# Altium schematic sheet Connector.SchDoc
size 420 x 297 mm; SheetNumber: 8; SheetTotal: 8
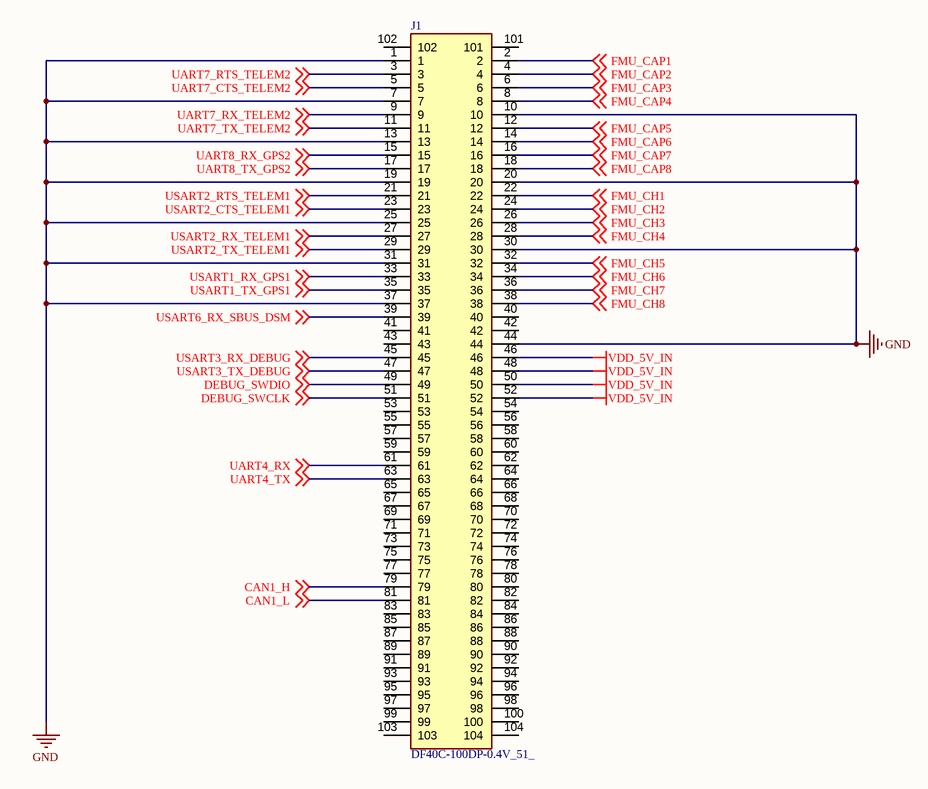
[diagram p0: Connector.SchDoc]

## Parts
J1  DF40C-100DP-0.4V_51_  [DF40C100DP04V51]

## Nets
GND: J1.1 J1.7 J1.10 J1.13 J1.19 J1.20 J1.25 J1.30 J1.31 J1.37 J1.44
VDD_5V_IN: J1.46 J1.48 J1.50 J1.52
CAN1_H: J1.79 ; off-sheet CAN1_H
CAN1_L: J1.81 ; off-sheet CAN1_L
DEBUG_SWCLK: J1.51 ; off-sheet DEBUG_SWCLK
DEBUG_SWDIO: J1.49 ; off-sheet DEBUG_SWDIO
FMU_CAP1: J1.2 ; off-sheet FMU_CAP1
FMU_CAP2: J1.4 ; off-sheet FMU_CAP2
FMU_CAP3: J1.6 ; off-sheet FMU_CAP3
FMU_CAP4: J1.8 ; off-sheet FMU_CAP4
FMU_CAP5: J1.12 ; off-sheet FMU_CAP5
FMU_CAP6: J1.14 ; off-sheet FMU_CAP6
FMU_CAP7: J1.16 ; off-sheet FMU_CAP7
FMU_CAP8: J1.18 ; off-sheet FMU_CAP8
FMU_CH1: J1.22 ; off-sheet FMU_CH1
FMU_CH2: J1.24 ; off-sheet FMU_CH2
FMU_CH3: J1.26 ; off-sheet FMU_CH3
FMU_CH4: J1.28 ; off-sheet FMU_CH4
FMU_CH5: J1.32 ; off-sheet FMU_CH5
FMU_CH6: J1.34 ; off-sheet FMU_CH6
FMU_CH7: J1.36 ; off-sheet FMU_CH7
FMU_CH8: J1.38 ; off-sheet FMU_CH8
UART4_RX: J1.61 ; off-sheet UART4_RX
UART4_TX: J1.63 ; off-sheet UART4_TX
UART7_CTS_TELEM2: J1.5 ; off-sheet UART7_CTS_TELEM2
UART7_RTS_TELEM2: J1.3 ; off-sheet UART7_RTS_TELEM2
UART7_RX_TELEM2: J1.9 ; off-sheet UART7_RX_TELEM2
UART7_TX_TELEM2: J1.11 ; off-sheet UART7_TX_TELEM2
UART8_RX_GPS2: J1.15 ; off-sheet UART8_RX_GPS2
UART8_TX_GPS2: J1.17 ; off-sheet UART8_TX_GPS2
USART1_RX_GPS1: J1.33 ; off-sheet USART1_RX_GPS1
USART1_TX_GPS1: J1.35 ; off-sheet USART1_TX_GPS1
USART2_CTS_TELEM1: J1.23 ; off-sheet USART2_CTS_TELEM1
USART2_RTS_TELEM1: J1.21 ; off-sheet USART2_RTS_TELEM1
USART2_RX_TELEM1: J1.27 ; off-sheet USART2_RX_TELEM1
USART2_TX_TELEM1: J1.29 ; off-sheet USART2_TX_TELEM1
USART3_RX_DEBUG: J1.45 ; off-sheet USART3_RX_DEBUG
USART3_TX_DEBUG: J1.47 ; off-sheet USART3_TX_DEBUG
USART6_RX_SBUS_DSM: J1.39 ; off-sheet USART6_RX_SBUS_DSM

Not connected (* = marked no-connect by the designer): J1 40 41 42 43 53 54 55 56 57 58 59 60 62 64 65 66 67 68 69 70 71 72 73 74 75 76 77 78 80 82 83 84 85 86 87 88 89 90 91 92 93 94 95 96 97 98 99 100 101 102 103 104

## Notes on the sheet
- THIS DOCUMENT AND THE DATA DISCLOSED HEREIN OR
- HEREWITH IS THE PROPERTY OF ALTIUM LIMITED AND MAY
- DWG NO:
- REVISION
- REV:
- DESCRIPTION
- DATE
- APPROVED
- BE FREELY DISTRIBUTED IN WHOLE. NO RIGHTS ARE
- RESERVED OR EXPRESS OR IMPLIED WARANTEE GIVEN.
- ENG:
- APPROVALS
- PROJECT
- DSN:
- CHK:
- REFERENCE DOCUMENTS
- PROJECT REVISION:
- TITLE
- DOCUMENT REVISION:
- DESIGN ITEM:
- BOM:
- FAB DWG:
- PCB DWG:
- ASSY DWG:
- SCALE:
- A3
- SIZE
- CAGE CODE
- FILE NAME
- DWG NO.
- SHEET
- OF
- REV

## Library data of the parts
J1 = CMP-002-00076-1: HIROSE(HRS) - DF40C-100DP-0.4V(51) - CONN, STACKING, HEADER, 100POS, 2ROW; Geometry.Height: 1mm; Manufacturer_Part_Number: DF40C-100DP-0.4V(51); Design Item ID: DF40C-100DP-0.4V_51_; Source: DF40C-100DP-0.4V_51_.SchLib; Mouser Price/Stock: https://www.mouser.co.uk/ProductDetail/Hirose-Connector/DF40C-100DP-0.4V51?qs=eDUdFcBPps2TxbrE27%2Ff2A%3D%3D; Mouser Part Number: 798-DF40C100DP0.4V51; Datasheet Link: https://datasheet.datasheetarchive.com/originals/distributors/SFDatasheet-7/sf-000141247.pdf; Manufacturer_Name: Hirose